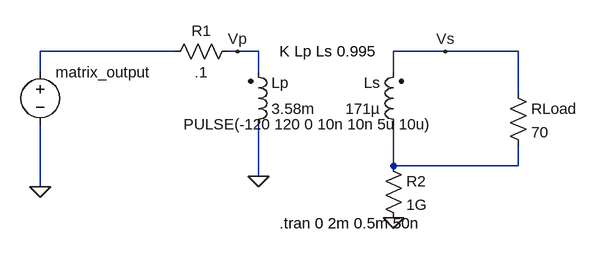
[diagram p0: schematic transformer.asc]
transformer.asc, the LTspice schematic file:
Version 4
SHEET 1 964 680
WIRE 160 96 -48 96
WIRE 256 96 240 96
WIRE 288 96 256 96
WIRE 576 96 496 96
WIRE 688 96 576 96
WIRE -48 128 -48 96
WIRE 288 128 288 96
WIRE 496 128 496 96
WIRE 688 160 688 96
WIRE 496 272 496 208
WIRE 688 272 688 240
WIRE 688 272 496 272
WIRE 288 288 288 208
WIRE -48 304 -48 208
FLAG 576 96 Vs
FLAG 288 288 0
FLAG -48 304 0
FLAG 256 96 Vp
FLAG 496 352 0
SYMBOL voltage -48 112 R0
WINDOW 123 0 0 Left 0
WINDOW 39 0 0 Left 0
WINDOW 3 221 96 Left 2
SYMATTR Value PULSE(-120 120 0 10n 10n 5u 10u)
SYMATTR InstName matrix_output
SYMBOL ind2 512 224 R180
WINDOW 0 36 80 Left 2
WINDOW 3 36 40 Left 2
SYMATTR InstName Ls
SYMATTR Value 171µ
SYMATTR Type ind
SYMBOL res 672 144 R0
SYMATTR InstName RLoad
SYMATTR Value 70
SYMBOL res 256 80 R90
WINDOW 0 0 56 VBottom 2
WINDOW 3 32 56 VTop 2
SYMATTR InstName R1
SYMATTR Value .1
SYMBOL res 480 256 R0
SYMATTR InstName R2
SYMATTR Value 1G
SYMBOL ind2 272 224 M180
WINDOW 0 36 80 Left 2
WINDOW 3 36 40 Left 2
SYMATTR InstName Lp
SYMATTR Value 3.58m
SYMATTR Type ind
TEXT 320 96 Left 2 !K Lp Ls 0.995
TEXT 320 360 Left 2 !.tran 0 2m 0.5m 50n

The netlist it stands for:
* transformer.asc
V§matrix_output N001 0 PULSE(-120 120 0 10n 10n 5u 10u)
Ls N002 Vs 171µ
RLoad Vs N002 70
R1 Vp N001 .1
R2 N002 0 1G
Lp 0 Vp 3.58m
K Lp Ls 0.995
.tran 0 2m 0.5m 50n
.backanno
.end